# Altium schematic sheet FMRD1616E.SchDoc: FM13RD1616E
size A2; Date: 2025-07-03; SheetNumber: 3; SheetTotal: 6
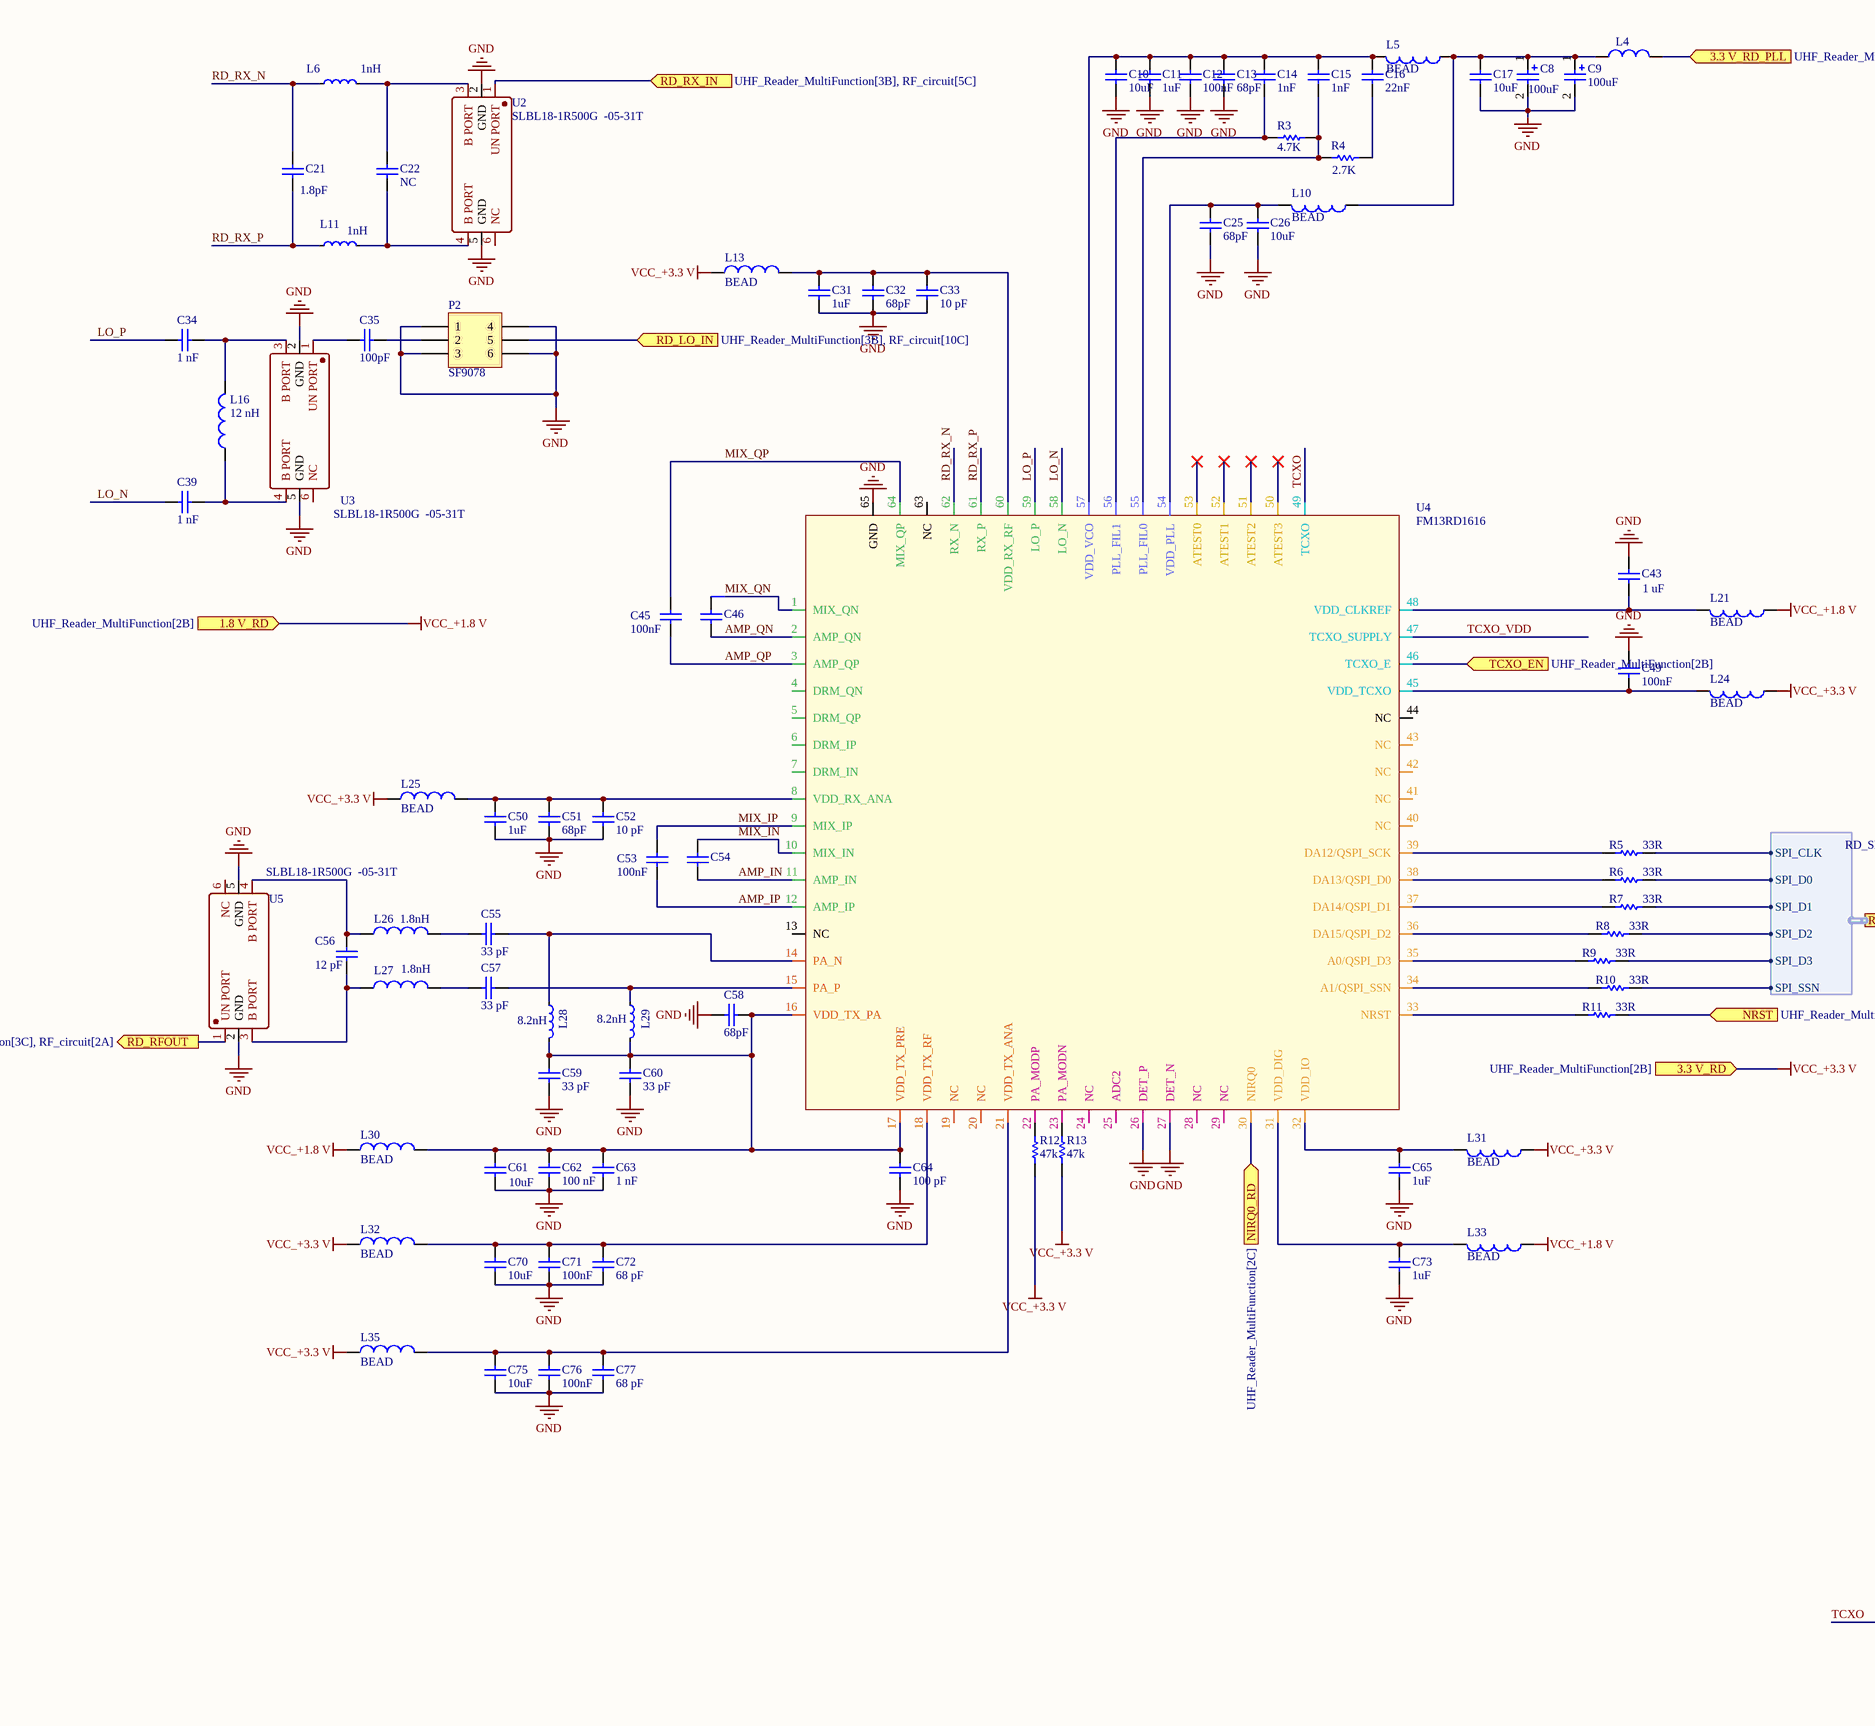
[diagram p0: FMRD1616E.SchDoc, left]
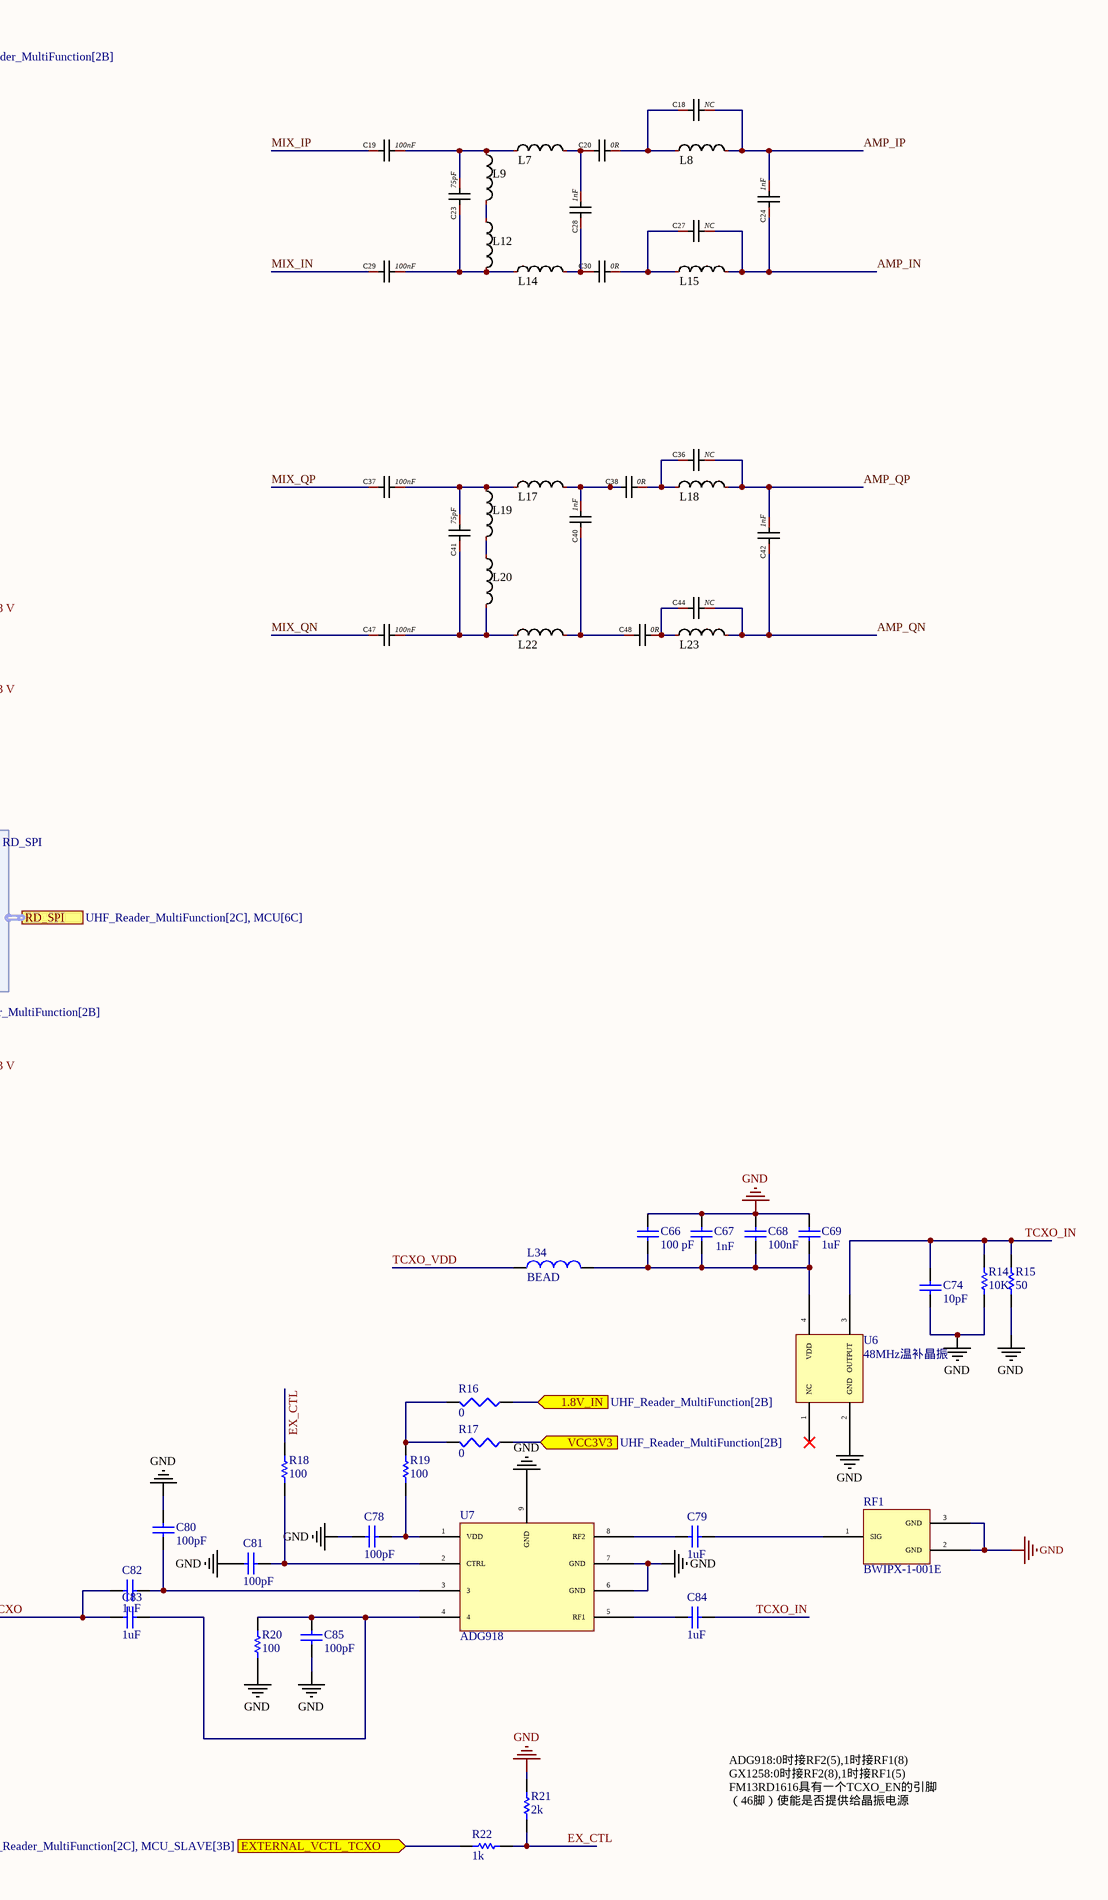
[diagram p1: FMRD1616E.SchDoc, right]

## Parts
C8  100uF  [0805_Z]
C9  100uF  [0805_Z]
C10  10uF  [0402_Z]
C11  1uF  [0402_Z]
C12  100nF  [0402_Z]
C13  68pF  [0402_Z]
C14  1nF  [0402_Z]
C15  1nF  [0402_Z]
C16  22nF  [0402_Z]
C17  10uF  [0603_Z]
C18  NC  [0402_Z]
C19  100nF  [0402_Z]
C20  0R  [0402_Z]
C21  1.8pF  [0402_Z]
C22  NC  [0402_Z]
C23  75pF  [0402_Z]
C24  1nF  [0402_Z]
C25  68pF  [0402_Z]
C26  10uF  [0603_Z]
C27  NC  [0402_Z]
C28  1nF  [0402_Z]
C29  100nF  [0402_Z]
C30  0R  [0402_Z]
C31  1uF  [0402_Z]
C32  68pF  [0402_Z]
C33  10 pF  [0402_Z]
C34  1 nF  [0402_Z]
C35  100pF  [0402_Z]
C36  NC  [0402_Z]
C37  100nF  [0402_Z]
C38  0R  [0402_Z]
C39  1 nF  [0402_Z]
C40  1nF  [0402_Z]
C41  75pF  [0402_Z]
C42  1nF  [0402_Z]
C43  1 uF  [0402_Z]
C44  NC  [0402_Z]
C45  100nF  [0402_Z]
C46  100nF  [0402_Z]  (value not drawn)
C47  100nF  [0402_Z]
C48  0R  [0402_Z]
C49  100nF  [0402_Z]
C50  1uF  [0402_Z]
C51  68pF  [0402_Z]
C52  10 pF  [0402_Z]
C53  100nF  [0402_Z]
C54  100nF  [0402_Z]  (value not drawn)
C55  33 pF  [0402_Z]
C56  12 pF  [0402_Z]
C57  33 pF  [0402_Z]
C58  68pF  [0402_Z]
C59  33 pF  [0402_Z]
C60  33 pF  [0402_Z]
C61  10uF  [0603_Z]
C62  100 nF  [0402_Z]
C63  1 nF  [0402_Z]
C64  100 pF  [0402_Z]
C65  1uF  [0402_Z]
C66  100 pF  [0402_Z]
C67  1nF  [0402_Z]
C68  100nF  [0402_Z]
C69  1uF  [0603_Z]
C70  10uF  [0603_Z]
C71  100nF  [0402_Z]
C72  68 pF  [0402_Z]
C73  1uF  [0402_Z]
C74  10pF  [0402_Z]
C75  10uF  [0603_Z]
C76  100nF  [0402_Z]
C77  68 pF  [0402_Z]
C78  100pF  [0402_Z]
C79  1uF  [0402_Z]
C80  100pF  [0402_Z]
C81  100pF  [0402_Z]
C82  1uF  [0402_Z]
C83  1uF  [0402_Z]
C84  1uF  [0402_Z]
C85  100pF  [0402_Z]
L4  (no value)  [0603_Z]
L5  BEAD  [0603_Z]
L6  1nH  [0402_Z]
L7  270uH  [1210_Z]  (value not drawn)
L8  390uH  [1210_Z]  (value not drawn)
L9  NC  [1210_Z]  (value not drawn)
L10  BEAD  [0603_Z]
L11  1nH  [0402_Z]
L12  NC  [1210_Z]  (value not drawn)
L13  BEAD  [0603_Z]
L14  270uH  [1210_Z]  (value not drawn)
L15  390uH  [1210_Z]  (value not drawn)
L16  12 nH  [0402_Z]
L17  270uH  [1210_Z]  (value not drawn)
L18  390uH  [1210_Z]  (value not drawn)
L19  NC  [1210_Z]  (value not drawn)
L20  NC  [1210_Z]  (value not drawn)
L21  BEAD  [0603_Z]
L22  270uH  [1210_Z]  (value not drawn)
L23  390uH  [1210_Z]  (value not drawn)
L24  BEAD  [0603_Z]
L25  BEAD  [0603_Z]
L26  1.8nH  [0402_Z]
L27  1.8nH  [0402_Z]
L28  8.2nH  [0402_Z]
L29  8.2nH  [0402_Z]
L30  BEAD  [0603_Z]
L31  BEAD  [0603_Z]
L32  BEAD  [0603_Z]
L33  BEAD  [0603_Z]
L34  BEAD  [0603_Z]
L35  BEAD  [0603_Z]
P2  SF9078  [SF8009]
R3  4.7K  [0402_Z]
R4  2.7K  [0402_Z]
R5  33R  [0402_Z]
R6  33R  [0402_Z]
R7  33R  [0402_Z]
R8  33R  [0402_Z]
R9  33R  [0402_Z]
R10  33R  [0402_Z]
R11  33R  [0402_Z]
R12  47k  [0402_Z]
R13  47k  [0402_Z]
R14  10K  [0402_Z]
R15  50  [0402_Z]
R16  0  [0402_Z]
R17  0  [0402_Z]
R18  100  [0402_Z]
R19  100  [0402_Z]
R20  100  [0402_Z]
R21  2k  [0402_Z]
R22  1k  [0402_Z]
RF1  BWIPX-1-001E  [IPEX-SMD_BWIPX-1-001E]
U2  SLBL18-1R500G  -05-31T  [Balun-0900BL15C050]
U3  SLBL18-1R500G  -05-31T  [Balun-0900BL15C050]
U4  FM13RD1616  [FM13RD1616E]
U5  SLBL18-1R500G  -05-31T  [Balun-0900BL15C050]
U6  48MHz温补晶振  [48MH温补晶振]
U7  ADG918  [ADG918]

## Ports
1.8 V_RD (in, see UHF_Reader_MultiFunction[2B]), 1.8V_IN (in, see UHF_Reader_MultiFunction[2B]), 3.3 V_RD (in, see UHF_Reader_MultiFunction[2B]), 3.3 V_RD_PLL (in, see UHF_Reader_MultiFunction[2B]), EXTERNAL_VCTL_TCXO (in, see UHF_Reader_MultiFunction[2C], MCU_SLAVE[3B]), NIRQ0_RD (in, see UHF_Reader_MultiFunction[2C]), NRST (in, see UHF_Reader_MultiFunction[2B]), RD_LO_IN (in, see UHF_Reader_MultiFunction[3B], RF_circuit[10C]), RD_RFOUT (out, see UHF_Reader_MultiFunction[3C], RF_circuit[2A]), RD_RX_IN (in, see UHF_Reader_MultiFunction[3B], RF_circuit[5C]), RD_SPI (harness RD_SPI, see UHF_Reader_MultiFunction[2C], MCU[6C]), TCXO_EN (in, see UHF_Reader_MultiFunction[2B]), VCC3V3 (in, see UHF_Reader_MultiFunction[2B])

## Harnesses
RD_SPI: SPI_SSN, SPI_D3, SPI_D2, SPI_D1, SPI_D0, SPI_CLK

## Nets
GND: C8.2 C9.2 C10.1 C11.1 C12.1 C13.1 C17.1 C25.1 C26.1 C31.1 C32.1 C33.1 C43.1 C49.1 C50.1 C51.1 C52.1 C58.2 C59.1 C60.2 C61.1 C62.1 C63.1 C64.2 C65.2 C66.1 C67.1 C68.1 C69.1 C70.1 C71.1 C72.1 C73.2 C74.2 C75.1 C76.1 C77.1 C78.1 C80.2 C81.1 C85.1 P2.1 P2.3 P2.4 P2.6 R14.2 R15.2 R20.1 R21.1 RF1.2(GND) RF1.3(GND) U2.2(GND) U2.5(GND) U3.2(GND) U3.5(GND) U4.26(DET_P) U4.27(DET_N) U4.65(GND) U5.2(GND) U5.5(GND) U6.2(GND) U7.6(GND) U7.7(GND) U7.9(GND)
VCC_+1.8 V: L21.1 L30.1 L33.1 ; port 1.8 V_RD
VCC_+3.3 V: L13.1 L24.1 L25.1 L31.1 L32.1 L35.1 R12.1 R13.1 ; port 3.3 V_RD
1.8V_IN: R16.1 ; port 1.8V_IN
3.3 V_RD_PLL: L4.2 ; port 3.3 V_RD_PLL
AMP_IN: C24.1 C27.2 C54.2 L15.2 U4.11(AMP_IN)
AMP_IP: C18.2 C24.2 C53.2 L8.2 U4.12(AMP_IP)
AMP_QN: C42.1 C44.2 C46.2 L23.2 U4.2(AMP_QN)
AMP_QP: C36.2 C42.2 C45.2 L18.2 U4.3(AMP_QP)
EX_CTL: R18.1 R21.2 R22.2
EXTERNAL_VCTL_TCXO: R22.1 ; port EXTERNAL_VCTL_TCXO
LO_N: C39.1 U4.58(LO_N)
LO_P: C34.1 U4.59(LO_P)
MIX_IN: C29.1 C54.1 U4.10(MIX_IN)
MIX_IP: C19.1 C53.1 U4.9(MIX_IP)
MIX_QN: C46.1 C47.1 U4.1(MIX_QN)
MIX_QP: C37.1 C45.1 U4.64(MIX_QP)
NIRQ0_RD: U4.30(NIRQ0) ; port NIRQ0_RD
NRST: R11.1 ; port NRST
RD_LO_IN: P2.5 ; port RD_LO_IN
RD_RFOUT: U5.1(UN_PORT) ; port RD_RFOUT
RD_RX_IN: U2.1(UN_PORT) ; port RD_RX_IN
RD_RX_N: C21.2 L6.1 U4.62(RX_N)
RD_RX_P: C21.1 L11.1 U4.61(RX_P)
TCXO: C82.1 C83.1 U4.49(TCXO)
TCXO_EN: U4.46(TCXO_E) ; port TCXO_EN
TCXO_IN: C74.1 C84.2 R14.1 R15.1 U6.3(OUTPUT)
TCXO_VDD: L34.1 U4.47(TCXO_SUPPLY)
VCC3V3: R17.1 ; port VCC3V3
NetC8_1: C8.1 C9.1 C17.2 L4.1 L5.1 L10.1
NetC10_2: C10.2 C11.2 C12.2 C13.2 C14.2 C15.2 C16.2 L5.2 U4.57(VDD_VCO)
NetC14_1: C14.1 R3.1 U4.56(PLL_FIL1)
NetC15_1: C15.1 R3.2 R4.1 U4.55(PLL_FIL0)
NetC16_1: C16.1 R4.2
NetC18_1: C18.1 C20.2 L8.1
NetC19_2: C19.2 C23.2 L7.1 L9.1
NetC20_1: C20.1 C28.2 L7.2
NetC22_1: C22.1 L11.2 U2.4(B_PORT)
NetC22_2: C22.2 L6.2 U2.3(B_PORT)
NetC23_1: C23.1 C29.2 L12.2 L14.1
NetC25_2: C25.2 C26.2 L10.2 U4.54(VDD_PLL)
NetC27_1: C27.1 C30.2 L15.1
NetC28_1: C28.1 C30.1 L14.2
NetC31_2: C31.2 C32.2 C33.2 L13.2 U4.60(VDD_RX_RF)
NetC34_2: C34.2 L16.2 U3.3(B_PORT)
NetC35_1: C35.1 U3.1(UN_PORT)
NetC35_2: C35.2 P2.2
NetC36_1: C36.1 C38.2 L18.1
NetC37_2: C37.2 C41.2 L17.1 L19.1
NetC38_1: C38.1 C40.2 L17.2
NetC39_2: C39.2 L16.1 U3.4(B_PORT)
NetC40_1: C40.1 C48.1 L22.2
NetC41_1: C41.1 C47.2 L20.2 L22.1
NetC43_2: C43.2 L21.2 U4.48(VDD_CLKREF)
NetC44_1: C44.1 C48.2 L23.1
NetC49_2: C49.2 L24.2 U4.45(VDD_TCXO)
NetC50_2: C50.2 C51.2 C52.2 L25.2 U4.8(VDD_RX_ANA)
NetC55_1: C55.1 L28.1 U4.14(PA_N)
NetC55_2: C55.2 L26.2
NetC56_1: C56.1 L26.1 U5.4(B_PORT)
NetC56_2: C56.2 L27.1 U5.3(B_PORT)
NetC57_1: C57.1 L29.1 U4.15(PA_P)
NetC57_2: C57.2 L27.2
NetC58_1: C58.1 C59.2 C60.1 C61.2 C62.2 C63.2 C64.1 L28.2 L29.2 L30.2 U4.16(VDD_TX_PA) U4.17(VDD_TX_PRE)
NetC65_1: C65.1 L31.2 U4.32(VDD_IO)
NetC66_2: C66.2 C67.2 C68.2 C69.2 L34.2 U6.4(VDD)
NetC70_2: C70.2 C71.2 C72.2 L32.2 U4.18(VDD_TX_RF)
NetC73_1: C73.1 L33.2 U4.31(VDD_DIG)
NetC75_2: C75.2 C76.2 C77.2 L35.2 U4.21(VDD_TX_ANA)
NetC78_2: C78.2 R19.2 U7.1(VDD)
NetC79_1: C79.1 RF1.1(SIG)
NetC79_2: C79.2 U7.8(RF2)
NetC80_1: C80.1 C82.2 U7.3
NetC81_2: C81.2 R18.2 U7.2(CTRL)
NetC83_2: C83.2 C85.2 R20.2 U7.4
NetC84_1: C84.1 U7.5(RF1)
NetL9_2: L9.2 L12.1
NetL19_2: L19.2 L20.1
NetR5_1: R5.1 ; port RD_SPI.SPI_CLK
NetR5_2: R5.2 U4.39(DA12/QSPI_SCK)
NetR6_1: R6.1 ; port RD_SPI.SPI_D0
NetR6_2: R6.2 U4.38(DA13/QSPI_D0)
NetR7_1: R7.1 ; port RD_SPI.SPI_D1
NetR7_2: R7.2 U4.37(DA14/QSPI_D1)
NetR8_1: R8.1 ; port RD_SPI.SPI_D2
NetR8_2: R8.2 U4.36(DA15/QSPI_D2)
NetR9_1: R9.1 ; port RD_SPI.SPI_D3
NetR9_2: R9.2 U4.35(A0/QSPI_D3)
NetR10_1: R10.1 ; port RD_SPI.SPI_SSN
NetR10_2: R10.2 U4.34(A1/QSPI_SSN)
NetR11_2: R11.2 U4.33(NRST)
NetR12_2: R12.2 U4.22(PA_MODP)
NetR13_2: R13.2 U4.23(PA_MODN)
NetR16_2: R16.2 R17.2 R19.1

Not connected (* = marked no-connect by the designer): U2 6(NC); U3 6(NC); U4 4(DRM_QN) 5(DRM_QP) 6(DRM_IP) 7(DRM_IN) 13(NC) 19(NC) 20(NC) 24(NC) 25(ADC2) 28(NC) 29(NC) 40(NC) 41(NC) 42(NC) 43(NC) 44(NC) 50(ATEST3)* 51(ATEST2)* 52(ATEST1)* 53(ATEST0)* 63(NC); U5 6(NC); U6 1(NC)*

## Notes on the sheet
- ADG918:0时接RF2(5),1时接RF1(8)
  GX1258:0时接RF2(8),1时接RF1(5)
  FM13RD1616具有一个TCXO_EN的引脚（46脚）使能是否提供给晶振电源

## Library data of the parts
C8 C9 = Cap Pol1: Polarized Capacitor (Radial); Published: 8-Jun-2000; LatestRevisionDate: 17-Jul-2002; LatestRevisionNote: Re-released for DXP Platform.; PackageReference: RB7.6-15; Publisher: Altium Limited; Value: 100uF
C10-C17 C25 C26 C35 C45 C46 C53 C54 C78 C80 C81 C85 = Cap: Capacitor; Published: 8-Jun-2000; LatestRevisionDate: 17-Jul-2002; LatestRevisionNote: Re-released for DXP Platform.; PackageReference: RAD-0.3; Publisher: Altium Limited
  C10 C17 C26: Value: 10uF
  C11: Value: 1uF
  C12 C45 C46 C53 C54: Value: 100nF
  C13 C25: Value: 68pF
  C14 C15: Value: 1nF
  C16: Value: 22nF
  C35 C78 C80 C81 C85: PackageDescription: Radial Cap, Thru-Hole; 2 Leads; 0.3 in Pin Spacing; Value: 100pF
C18-C20 C23 C24 C27-C30 C36-C38 C40-C42 C44 C47 C48 = Cap
C21 C22 C31-C34 C39 C43 C49-C52 C55-C77 C79 C82-C84 = Cap: Capacitor; Value: 100pF; Published: 8-Jun-2000; LatestRevisionDate: 17-Jul-2002; LatestRevisionNote: Re-released for DXP Platform.; PackageReference: RAD-0.3; Publisher: Altium Limited; PackageDescription: Radial Cap, Thru-Hole; 2 Leads; 0.3 in Pin Spacing
L4 = INDUCTOR1: INDUCTOR; Value: 33nH
L5 L10 L13 L16 L21 L24-L27 L30-L35 = Inductor: Code_IEC: 1005; Value: 10mH; Published: 8-Jun-2000; LatestRevisionDate: 29-May-2009; LatestRevisionNote: IPC-7351 Footprint Added.; PackageReference: 0402-A; Publisher: Altium Limited; PackageDescription: Chip Inductor; Code_JEITA: 0402
L6 L11 L28 L29 = IND: Inductor, 80mA, ±10%; Part Number: L0603-10µ; Manufacturer: Taiyo Yuden; Manufacturer Part Number: LBMF1608T100K; 2nd source part number: 178-6105; Note: LBMF1608T100K 10µH 80mA 0603; Artikkelnr Noca: 33029314; Artikkelnr Simpro: N.A.; Datasheet: http://www.yuden.co.jp/ut/product/pdf/elb2_e.pdf; LatestRevisionDate: 2012-09-19; Pin Count: 2; Publisher: Nordic Semiconductor; Published: 2010-02-24; Supplier: Digi-Key; Supplier part number: 587-1714-1-ND; 2nd source Supplier: Farnell; Footprint Doc: 0603; ComponentLink1Description: Datasheet; ComponentLink2Description: Supplier link
  L6 L11: Value: 1nH
  L28 L29: Value: 8.2nH
L7-L9 L12 L14 L15 L17-L20 L22 L23 = 470uH大电感: Manufacturer: FH(风华); Name: 470uH; Symbol: FHW1210IF471KST; Add into BOM: yes; Value: 470uH; Tolerance: ±10%; Rated Current: 40mA; DC Resistance (DCR): 22.5Ω; Q @ Freq: 8@796kHz; Frequency - Self Resonant: 2MHz; Device: FHW1210IF471KST; LCSC Part Name: 470uH ±10% 22.5Ω; Supplier Part: C75644; Manufacturer Part: FHW1210IF471KST; Supplier Footprint: 1210; JLCPCB Part Class: Extended Part; Datasheet: https://atta.szlcsc.com/upload/public/pdf/source/20230314/04CD9A2FDF314BADB654B282B27A36D2.pdf; Supplier: LCSC; Convert to PCB: yes; Saturation Current (Isat): -; Ratings: -
P2 = Header 3X2A: Header, 3-Pin, Dual row; LatestRevisionDate: 17-Jul-2002; LatestRevisionNote: Re-released for DXP Platform.; Publisher: Altium Limited
R3-R11 = Res1: Resistor; Published: 8-Jun-2000; Revision: July-2002: Re-released for DXP Platform.; Publisher: Altium Limited
  R3: Value: 4.7K
  R4: Value: 2.7K
  R5-R11: Value: 33R
R12 R13 = Res1: Resistor; Value: 1K; Published: 8-Jun-2000; LatestRevisionDate: 17-Jul-2002; LatestRevisionNote: Re-released for DXP Platform.; PackageReference: AXIAL-0.3; Publisher: Altium Limited; PackageDescription: Axial Device, Thru-Hole; 2 Leads; 0.3 in Pin Spacing
R14 R15 = Res: 0402; Value: 100R; Published: 8-Jun-2000; Revision: July-2002: Re-released for DXP Platform.; Publisher: Altium Limited
R16 R17 = Res3_14: Resistor; Published: 8-Jun-2000; LatestRevisionDate: 04-Mar-2005; LatestRevisionNote: PCB Footprint replaced.; PackageReference: J1-0603; Publisher: Altium Limited; Value: 0
R18-R20 = Resistor: Thick Film Resistor; Value: 2k
R21 R22 = Resistor: Thick Film Resistor
  R21: Value: 2k
  R22: Value: 1k